# Altium project Self_Balancing_Robot.PrjPcb
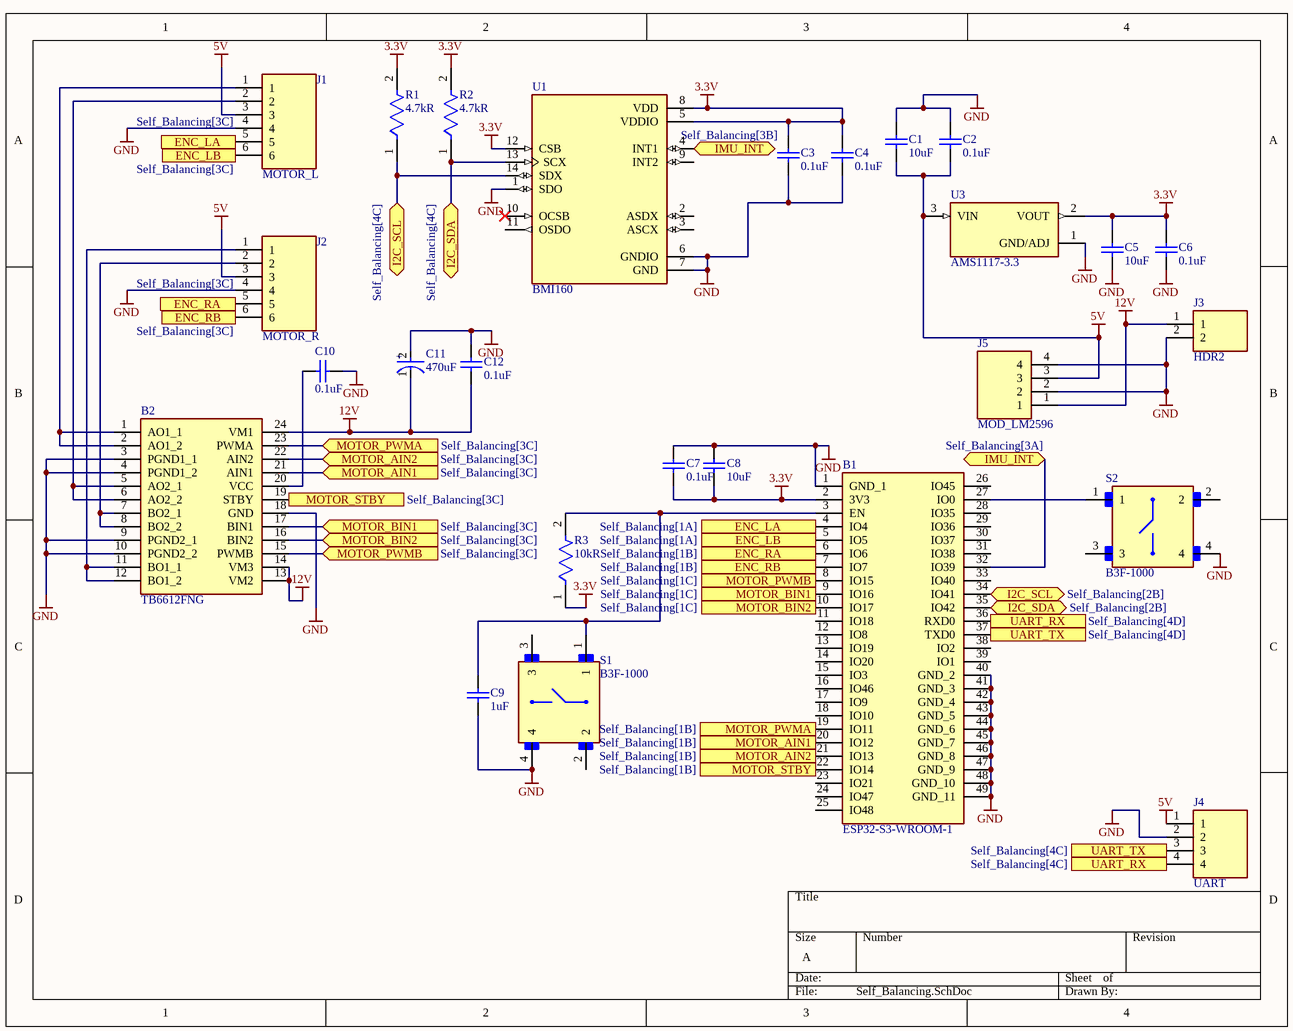
[diagram p0: Self_Balancing.SchDoc]
1 sheet, 26 parts. Net scope: flat (ports and power ports of the same name join across sheets).
Board file: Self_Balancing.PcbDoc

## Sheet Self_Balancing.SchDoc
size A; SheetNumber: 1; SheetTotal: 1

### Parts
B1  ESP32-S3-WROOM-1  [ESP32S3WROOM1]
B2  TB6612FNG  [SOP65P760X160-24N]
C1  10uF  [CAPC2013X140X50ML20T25]
C2  0.1uF  [CAPC0805(2012)100_M]
C3  0.1uF  [CAPC0805(2012)100_M]
C4  0.1uF  [CAPC0805(2012)100_M]
C5  10uF  [CAPC2013X140X50ML20T25]
C6  0.1uF  [CAPC0805(2012)100_M]
C7  0.1uF  [CAPC0805(2012)100_M]
C8  10uF  [CAPC2013X140X50ML20T25]
C9  1uF  [CAPC2013X140X50NL20T25]
C10  0.1uF  [CAPC0805(2012)100_M]
C11  470uF  [FP-RAD-TH-D_12_5_0_5-L_30-MFG]
C12  0.1uF  [CAPC0805(2012)100_M]
J1  MOTOR_L  [WAFERXH2546PZZ]
J2  MOTOR_R  [WAFERXH2546PZZ]
J3  HDR2  [SHDR2W64P0X254_1X2_508X580X1170P]
J4  UART  [HDRV4W95P0X254_1X4_1016X254X854P]
J5  MOD_LM2596  [HDRV4W95P0X254_1X4_1016X254X854P]
R1  4.7kR  [FP-RMCF0805-MFG]
R2  4.7kR  [FP-RMCF0805-MFG]
R3  10kR  [FP-CRGP0805-IPC_C]
S1  B3F-1000  [SW_B3F-1000]
S2  B3F-1000  [SW_B3F-1000]
U1  BMI160  [PQFN50P250X300X88-14N]
U3  AMS1117-3.3  [SOT229P700X180-4N]

### Ports
ENC_LA (in, see Self_Balancing[1A]), ENC_LA (out, see Self_Balancing[3C]), ENC_LB (in, see Self_Balancing[1A]), ENC_LB (out, see Self_Balancing[3C]), ENC_RA (in, see Self_Balancing[1B]), ENC_RA (out, see Self_Balancing[3C]), ENC_RB (in, see Self_Balancing[1B]), ENC_RB (out, see Self_Balancing[3C]), I2C_SCL (bidir, see Self_Balancing[2B]), I2C_SCL (bidir, see Self_Balancing[4C]), I2C_SDA (bidir, see Self_Balancing[2B]), I2C_SDA (bidir, see Self_Balancing[4C]), IMU_INT (bidir, see Self_Balancing[3A]), IMU_INT (bidir, see Self_Balancing[3B]), MOTOR_AIN1 (in, see Self_Balancing[3C]), MOTOR_AIN1 (out, see Self_Balancing[1B]), MOTOR_AIN2 (in, see Self_Balancing[3C]), MOTOR_AIN2 (out, see Self_Balancing[1B]), MOTOR_BIN1 (in, see Self_Balancing[3C]), MOTOR_BIN1 (out, see Self_Balancing[1C]), MOTOR_BIN2 (in, see Self_Balancing[3C]), MOTOR_BIN2 (out, see Self_Balancing[1C]), MOTOR_PWMA (in, see Self_Balancing[3C]), MOTOR_PWMA (out, see Self_Balancing[1B]), MOTOR_PWMB (in, see Self_Balancing[3C]), MOTOR_PWMB (out, see Self_Balancing[1C]), MOTOR_STBY (in, see Self_Balancing[3C]), MOTOR_STBY (out, see Self_Balancing[1B]), UART_RX (in, see Self_Balancing[4D]), UART_RX (out, see Self_Balancing[4C]), UART_TX (in, see Self_Balancing[4C]), UART_TX (out, see Self_Balancing[4D])

### Nets
3.3V: B1.2(3V3) C3.1 C4.1 C5.1 C6.1 C7.2 C8.1 R1.2 R2.2 R3.1 U1.5(VDDIO) U1.8(VDD) U1.12(CSB) U3.2(VOUT)
5V: C1.1 C2.2 J1.3 J2.3 J4.1 J5.3 U3.3(VIN)
12V: B2.13(VM2) B2.14(VM3) B2.24(VM1) C11.1(C) C12.2 J3.1 J5.1
GND: B1.1(GND_1) B1.40(GND_2) B1.41(GND_3) B1.42(GND_4) B1.43(GND_5) B1.44(GND_6) B1.45(GND_7) B1.46(GND_8) B1.47(GND_9) B1.48(GND_10) B1.49(GND_11) B2.3(PGND1_1) B2.4(PGND1_2) B2.9(PGND2_1) B2.10(PGND2_2) B2.18(GND) C1.2 C2.1 C3.2 C4.2 C5.2 C6.2 C7.1 C8.2 C9.1 C10.2 C11.2(A) C12.1 J1.4 J2.4 J3.2 J4.2 J5.2 J5.4 S1.4 S2.4 U1.1(SDO) U1.6(GNDIO) U1.7(GND) U3.1(GND/ADJ)
NetB1_3: B1.3(EN) C9.2 R3.2 S1.1
NetB1_4: B1.4(IO4) J1.5 ; port ENC_LA
NetB1_5: B1.5(IO5) J1.6 ; port ENC_LB
NetB1_6: B1.6(IO6) J2.5 ; port ENC_RA
NetB1_7: B1.7(IO7) J2.6 ; port ENC_RB
NetB1_8: B1.8(IO15) B2.15(PWMB) ; port MOTOR_PWMB
NetB1_9: B1.9(IO16) B2.17(BIN1) ; port MOTOR_BIN1
NetB1_10: B1.10(IO17) B2.16(BIN2) ; port MOTOR_BIN2
NetB1_19: B1.19(IO11) B2.23(PWMA) ; port MOTOR_PWMA
NetB1_20: B1.20(IO12) B2.21(AIN1) ; port MOTOR_AIN1
NetB1_21: B1.21(IO13) B2.22(AIN2) ; port MOTOR_AIN2
NetB1_22: B1.22(IO14) B2.19(STBY) ; port MOTOR_STBY
NetB1_27: B1.27(IO0) S2.1
NetB1_32: B1.32(IO39) U1.4(INT1) ; port IMU_INT
NetB1_34: B1.34(IO41) R1.1 U1.14(SDX) ; port I2C_SCL
NetB1_35: B1.35(IO42) R2.1 U1.13(SCX) ; port I2C_SDA
NetB1_36: B1.36(RXD0) J4.4 ; port UART_RX
NetB1_37: B1.37(TXD0) J4.3 ; port UART_TX
NetB2_1: B2.1(AO1_1) B2.2(AO1_2) J1.1
NetB2_5: B2.5(AO2_1) B2.6(AO2_2) J1.2
NetB2_7: B2.7(BO2_1) B2.8(BO2_2) J2.2
NetB2_11: B2.11(BO1_1) B2.12(BO1_2) J2.1
NetB2_20: B2.20(VCC) C10.1

Not connected (* = marked no-connect by the designer): B1 11(IO18) 12(IO8) 13(IO19) 14(IO20) 15(IO3) 16(IO46) 17(IO9) 18(IO10) 23(IO21) 24(IO47) 25(IO48) 26(IO45) 28(IO35) 29(IO36) 30(IO37) 31(IO38) 33(IO40) 38(IO2) 39(IO1); S1 2 3; S2 2 3; U1 2(ASDX) 3(ASCX) 9(INT2) 10(OCSB)* 11(OSDO)

### Notes on the sheet
- (in symbol CMP-05427-000129-1) +

### Library data of the parts
B1 = ESP32-S3-WROOM-1: WiFi Modules - 802.11 (Engineering Samples Only) SMD Module, ESP32-S3, 8 MB SPI Flash, PCB Antenna; Manufacturer_Name: Espressif Systems; Geometry.Height: 3.25mm; Manufacturer_Part_Number: ESP32-S3-WROOM-1; Mouser Part Number: *; Mouser Price/Stock: *; Arrow Part Number: *; Arrow Price/Stock: *; Datasheet Link: https://www.mouser.com/catalog/specsheets/Espressif_ESP32_S3_WROOM_1_1U_Preliminary.pdf
B2 = TB6612FNG: Brush motor driver IC; Manufacturer_Name: Toshiba; Geometry.Height: 1.6mm; Manufacturer_Part_Number: TB6612FNG; Mouser Part Number: N/A; Mouser Price/Stock: https://www.mouser.co.uk/ProductDetail/Toshiba/TB6612FNG?qs=By6Nw2ByBD2hYPrK9yTkWQ%3D%3D; Arrow Part Number: *; Arrow Price/Stock: *; Datasheet Link: https://datasheet.datasheetarchive.com/originals/distributors/SFDatasheet-6/sf-000138015.pdf
C1 C5 C8 = CMP-2007-03244-1: Manufacturer: Kemet; Part Number: C0805C106K9RACTU
C2-C4 C6 C7 C10 C12 = CMP-1036-04393-1: CAP 100nF 10V ±5% 0805 (2012 Metric) Thickness 1mm SMD; Tolerance: Â±5%; Case-EIA: 0805; Case-Metric: 2012; Rated Voltage: 10 V; Technology: SMT; Value: 100nF; Max Thickness: 1 mm
C9 = CMP-2007-04663-1: Part Number: 0805YD105MAT2A; Manufacturer: AVX Interconnect / Elco
C11 = CMP-05427-000129-1: Aluminum Electrolytic Capacitors (Radial Lead Type) 470uF ±20% 80V; RoHS Compliant: Yes
J1 J2 = WAFER-XH2.54-6PZZ: 1x6P 1 6P 2.54mm 6 -25~+85 2A Straight Plugin,P=2.54mm Wire To Board Connector ROHS; Manufacturer_Name: XUNPU; Geometry.Height: 7.25mm; Manufacturer_Part_Number: WAFER-XH2.54-6PZZ; Mouser Part Number: *; Mouser Price/Stock: *; Arrow Part Number: *; Arrow Price/Stock: *; Datasheet Link: https://wmsc.lcsc.com/wmsc/upload/file/pdf/v2/lcsc/2302211801_XUNPU-WAFER-XH2-54-6PZZ_C5359634.pdf
J3 = 0022272021: KK 254 Wire-to-Board Header, Vertical, with Friction Lock, 2 Circuits, Tin (Sn) Plating; Manufacturer_Name: Molex; Geometry.Height: 11.7mm; Manufacturer_Part_Number: 0022272021; Mouser Part Number: N/A; Mouser Price/Stock: https://www.mouser.co.uk/ProductDetail/Molex/0022272021?qs=PBcRNPEHKsoTuJ7eDXMaUA%3D%3D; Arrow Part Number: 0022272021; Arrow Price/Stock: https://www.arrow.com/en/products/0022272021/molex?utm_currency=USD&region=nac; Datasheet Link: https://www.molex.com/en-us/products/part-detail-pdf/22272021?display=pdf
J4 J5 = 61300411121: WR-PHD 2.54 mm Pin Header 4 pins, 1 row, straight, gold plating; Manufacturer_Name: Wurth Elektronik; Geometry.Height: 8.54mm; Manufacturer_Part_Number: 61300411121; Mouser Part Number: 710-61300411121; Mouser Price/Stock: https://www.mouser.co.uk/ProductDetail/Wurth-Elektronik/61300411121?qs=PhR8RmCirEYQcLLqXD8rAA%3D%3D; Arrow Part Number: *; Arrow Price/Stock: *; Datasheet Link: https://www.we-online.com/components/products/datasheet/61300411121.pdf
R1 R2 = CMP-26527-004085-1: 4.7kΩ ±5% 0.125W 0805 Thick Film Chip Resistor AEC-Q200 compliant; Temperature Coefficient: 200ppm/°C; Max Power Dissipation: 125mW; RoHS Compliant: Yes; Package Quantity: 10000; Packaging: Tape and Reel; Contact Plating: Tin; Radiation Hardening: No; Mount: Surface Mount; Height: 0.026inch; Case Code (Metric): 2012; Tolerance: 5%; Case/Package: 0805; Width: 0.049inch; Series: RMCF; Case Code (Imperial): 0805; Number of Terminations: 2; Min Operating Temperature: -55°C; Resistor Type: Thick Film; Resistance: 4.7kR; Max Operating Temperature: 155°C; Length: 0.079inch; Features: Automotive AEC-Q200
R3 = CMP-03211-006861-1: CRGP 0805 10K 1%; Manufacturer Part Number: CRGP0805F10K; Manufacturer: TE; Power Rating: 0.33W; Description: CRGP0805 10KΩ 0.33W ±100ppm/°C 1% 150V; Voltage Rating: 150V; Value: 10KΩ; Tolerance: 0.01; Temperature Coefficient: ±100ppm/°C; ComponentLink2URL: https://www.mouser.com/datasheet/2/418/NG_DS_9-1773463-9_A-1358566.pdf; Temperature Range Low: -55°C; Ipc Land Pattern Name: RESC200125X55; Device Class L2: Resistors; Automotive: No; Device Class L3: Chip SMD Resistors; Composition: Thick Film; Temperature Range High: +155°C; Temperature: -55°C to +155°C; Height: 0.65mm; Series: CRGP; RoHS: TRUE; Device Class L1: Passive Components; Octopart: https://octopart.com/crgp0805f10k-te+connectivity-91018782; Package: CRGP0805; Digikey Description: CRGP 0805 10K 1%; Ambient Temperature Range High: +70°C; Lead Free: Yes; ComponentLink2Description: Datasheet; Category: Res; Resistance: 10KΩ
S1 S2 = B3F-1000: Tactile Switch SPST-NO Top Actuated Through Hole; MF: Omron; Price: None; Check_prices: https://www.snapeda.com/parts/B3F-1000/Omron+Electronics+Inc-EMC+Div/view-part/?ref=eda; Purchase-URL: https://pricing.snapeda.com/search/part/B3F-1000/?ref=eda; Value: *; Package: None; Availability: In Stock; MP: B3F-1000; SnapEDA_Link: https://www.snapeda.com/parts/B3F-1000/Omron+Electronics+Inc-EMC+Div/view-part/?ref=snap
U1 = BMI160: Accelerometer, Gyroscope, 6 Axis Sensor IÂ²C, SPI Output; Package: None; Price: None; Availability: Unavailable; MP: BMI160; Value: *; ComponentLink1Description: New link; ComponentLink1URL: *
U3 = AMS1117-3.3: Sot223/Pkg 1-Amp 3.3-Volt Low Drop Out Voltage Regulatator; MF: Advanced Monolithic Systems; SnapEDA_Link: https://www.snapeda.com/parts/AMS1117-3.3/Advanced+Monolithic+Systems/view-part/?ref=snap; Package: SOT-223 Seeed Technology; Value: *; MP: AMS1117-3.3; Check_prices: https://www.snapeda.com/parts/AMS1117-3.3/Advanced+Monolithic+Systems/view-part/?ref=eda